# Altium schematic sheet signal-light-7.SchDoc
size A4; SheetNumber: 10; SheetTotal: 21
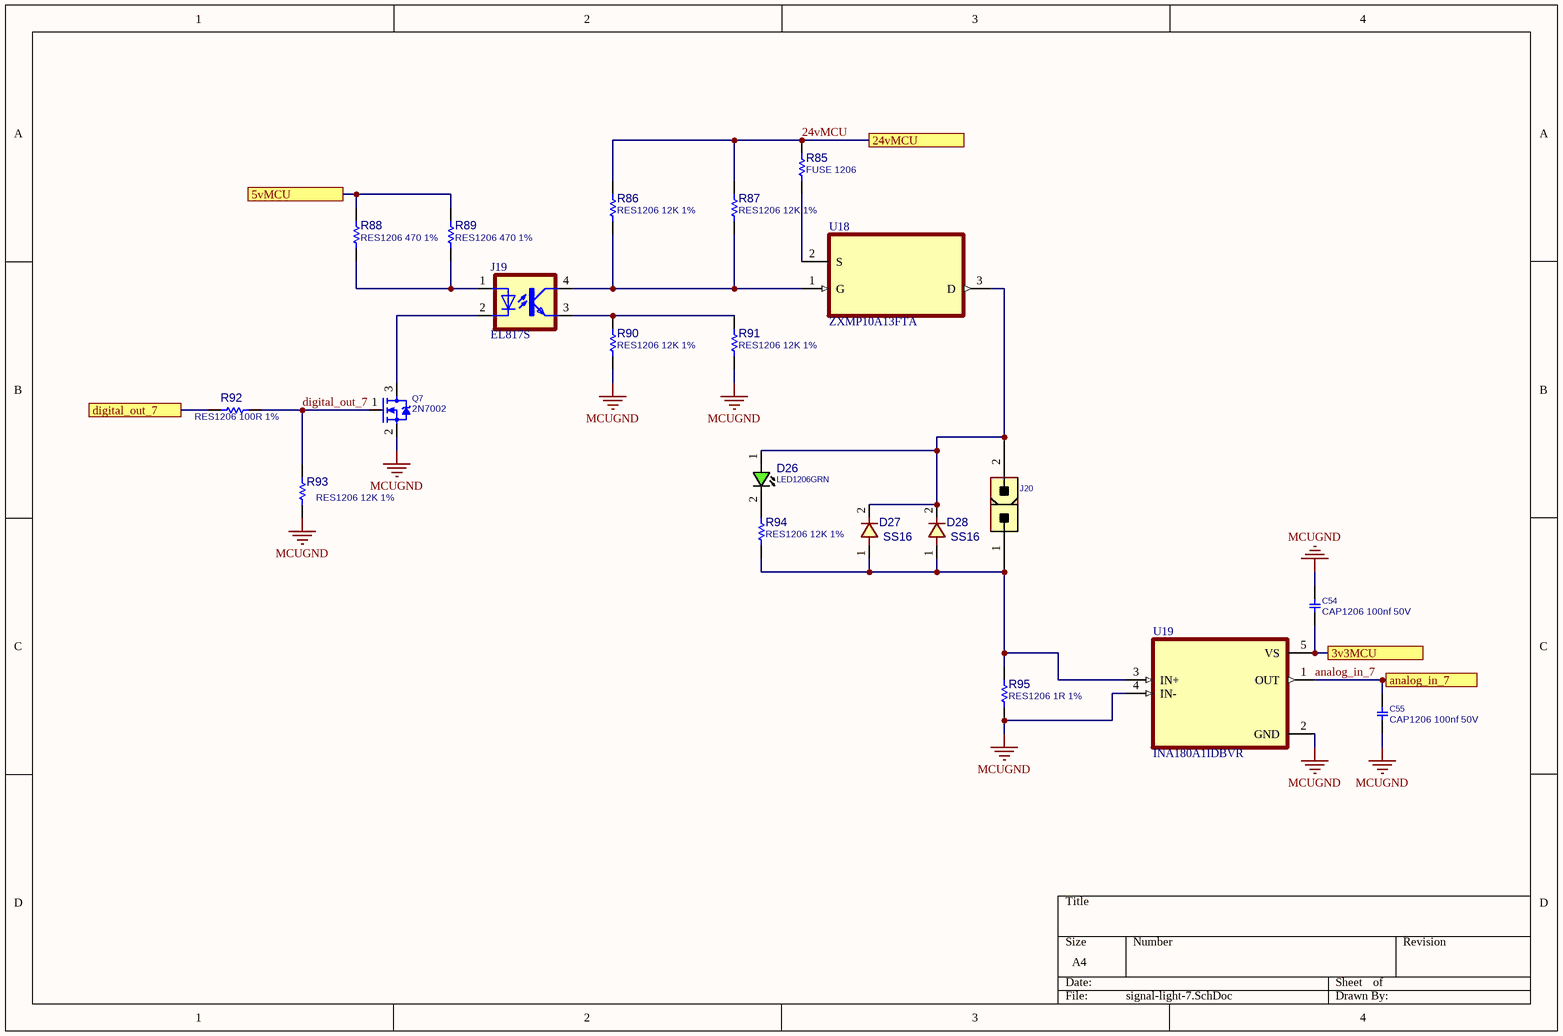
[diagram p0: signal-light-7.SchDoc]

## Parts
C54  CAP1206 100nf 50V  [C1206]
C55  CAP1206 100nf 50V  [C1206]
D26  LED1206GRN  [LED1206GRN]
D27  SS16  [D_SMA]
D28  SS16  [D_SMA]
J19  EL817S  [SOIC254P1030X460-4N]
J20  CONN_ATXPWR_2  [ATXPWR_2]  (value not drawn)
Q7  2N7002  [SOT23_3]
R85  FUSE 1206  [R1206]
R86  RES1206 12K 1%  [R1206]
R87  RES1206 12K 1%  [R1206]
R88  RES1206 470 1%  [R1206]
R89  RES1206 470 1%  [R1206]
R90  RES1206 12K 1%  [R1206]
R91  RES1206 12K 1%  [R1206]
R92  RES1206 100R 1%  [R1206]
R93  RES1206 12K 1%  [R1206]
R94  RES1206 12K 1%  [R1206]
R95  RES1206 1R 1%  [R1206]
U18  ZXMP10A13FTA  [SOT95P230X110-3N]
U19  INA180A1IDBVR  [SOT95P280X145-5N]

## Ports
3v3MCU, 5vMCU, 24vMCU, analog_in_7, digital_out_7

## Nets
MCUGND: C54.1 C55.2 Q7.2(SOURCE) R90.2 R91.2 R93.2 R95.2 U19.2(GND) U19.4(IN-)
3v3MCU: C54.2 U19.5(VS) ; port 3v3MCU
5vMCU: R88.2 R89.2 ; port 5vMCU
24vMCU: R85.1 R86.1 R87.1 ; port 24vMCU
analog_in_7: C55.1 U19.1(OUT) ; port analog_in_7
digital_out_7: Q7.1(GATE) R92.2 R93.1
digital_out_7: R92.1 ; port digital_out_7  [a separate net that carries the same name]
NetD26_1: D26.1(ANODE) D27.2 D28.2 J20.2 U18.3(D)
NetD26_2: D26.2(CATHODE) R94.1
NetD27_1: D27.1 D28.1 J20.1 R94.2 R95.1 U19.3(IN+)
NetJ19_1: J19.1(A) R88.1 R89.1
NetJ19_2: J19.2(C) Q7.3(DRAIN)
NetJ19_3: J19.3(EMIT) R90.1 R91.1
NetJ19_4: J19.4(COL) R86.2 R87.2 U18.1(G)
NetR85_2: R85.2 U18.2(S)

## Library data of the parts
C54 C55 = CAP_SMD_MLCC_1206: CAP, MLCC; PARAM: -, -%; MANF_P#: MANF_PART#; PARAM2: -V; PRICE: 100= 1$; MANF: -; ASSEMBLY: ASSEMBLY
D26 = LED_SMD_1206_GRN: LED, SMD, 1206, GREEN; PARAM: 20mA; DESC: DESCRIPTION; PARAM2: 2.2V; MANF: -; ASSEMBLY: ASSEMBLY; PRICE: 36t@Javan; MANF_P#: -; VALUE: LED1206GRN; MountType: SMT; PartType: LED
D27 D28 = DIODE_SMD_1N4001: DIODE, GENERAL PURPOSE, 50V/1A; DESC: DESCRIPTION; PARAM: 50V VRRM; PARAM2: 1A; MANF_P#: 1N4001; MANF: MANF; ASSEMBLY: ASSEMBLY; PRICE: PRICE; VALUE: SS16
J19 = EL817S: Optoisolator Transistor Output 5000Vrms 1 Channel 4-SMD; MF: Everlight Electronics; SnapEDA_Link: https://www.snapeda.com/parts/EL817S/Everlight+Electronics+Co+Ltd/view-part/?ref=snap; Package: SMD-4 Everlight Electronics Co Ltd; Value: *; MP: EL817S; Check_prices: https://www.snapeda.com/parts/EL817S/Everlight+Electronics+Co+Ltd/view-part/?ref=eda
J20 = CONN_ATXPWR_2: CONN, ATX POWER, 2 P; MANF: Molex; MANF_P#: 39281023; VALUE: CONN_ATXPWR_2; MountType: THD; PACKAGE: ATXPWR-2pin; Part Type: Conn.
Q7 = MOSN_2N7002_SOT23: MOSFET, N-CH, 60V, 0.3A; MANF: NXP; ASSEMBLY: ASSEMBLY; MANF_P#: 2N7002; PARAM2: 60v; PARAM: 0.3A; PRICE: 0.3t@Javan; VALUE: 2N7002
R85-R95 = RES_SMD_1206: RESISTOR, SMD; PARAM: 1%, 0.25W; DESC: DESCRIPTION; DIST#: MOUSER; MANF_P#: -; MANF: -; ASSEMBLY: ASSEMBLY; PRICE: -; PARAM2: -
U18 = ZXMP10A13FTA: P-Channel 100 V 600mA (Ta) 625mW (Ta) Surface Mount SOT-23-3; MF: Diodes Inc.; Purchase-URL: https://pricing.snapeda.com/search/part/ZXMP10A13FTA/?ref=eda; Package: SOT-23-3 Diodes Inc.; SnapEDA_Link: https://www.snapeda.com/parts/ZXMP10A13FTA/Diodes+Inc./view-part/?ref=snap; Availability: In Stock; Value: *; MP: ZXMP10A13FTA; Check_prices: https://www.snapeda.com/parts/ZXMP10A13FTA/Diodes+Inc./view-part/?ref=eda; Price: None
U19 = INA180A1IDBVR: 26V, 350kHz current sense amplifier; MF: Texas Instruments; SnapEDA_Link: https://www.snapeda.com/parts/INA180A1IDBVR/Texas+Instruments/view-part/?ref=snap; Package: SOT-23-5 Texas Instruments; Value: *; MP: INA180A1IDBVR; Check_prices: https://www.snapeda.com/parts/INA180A1IDBVR/Texas+Instruments/view-part/?ref=eda